# Altium schematic sheet 03 DRV.SchDoc
size A4; SheetNumber: 3; SheetTotal: 4
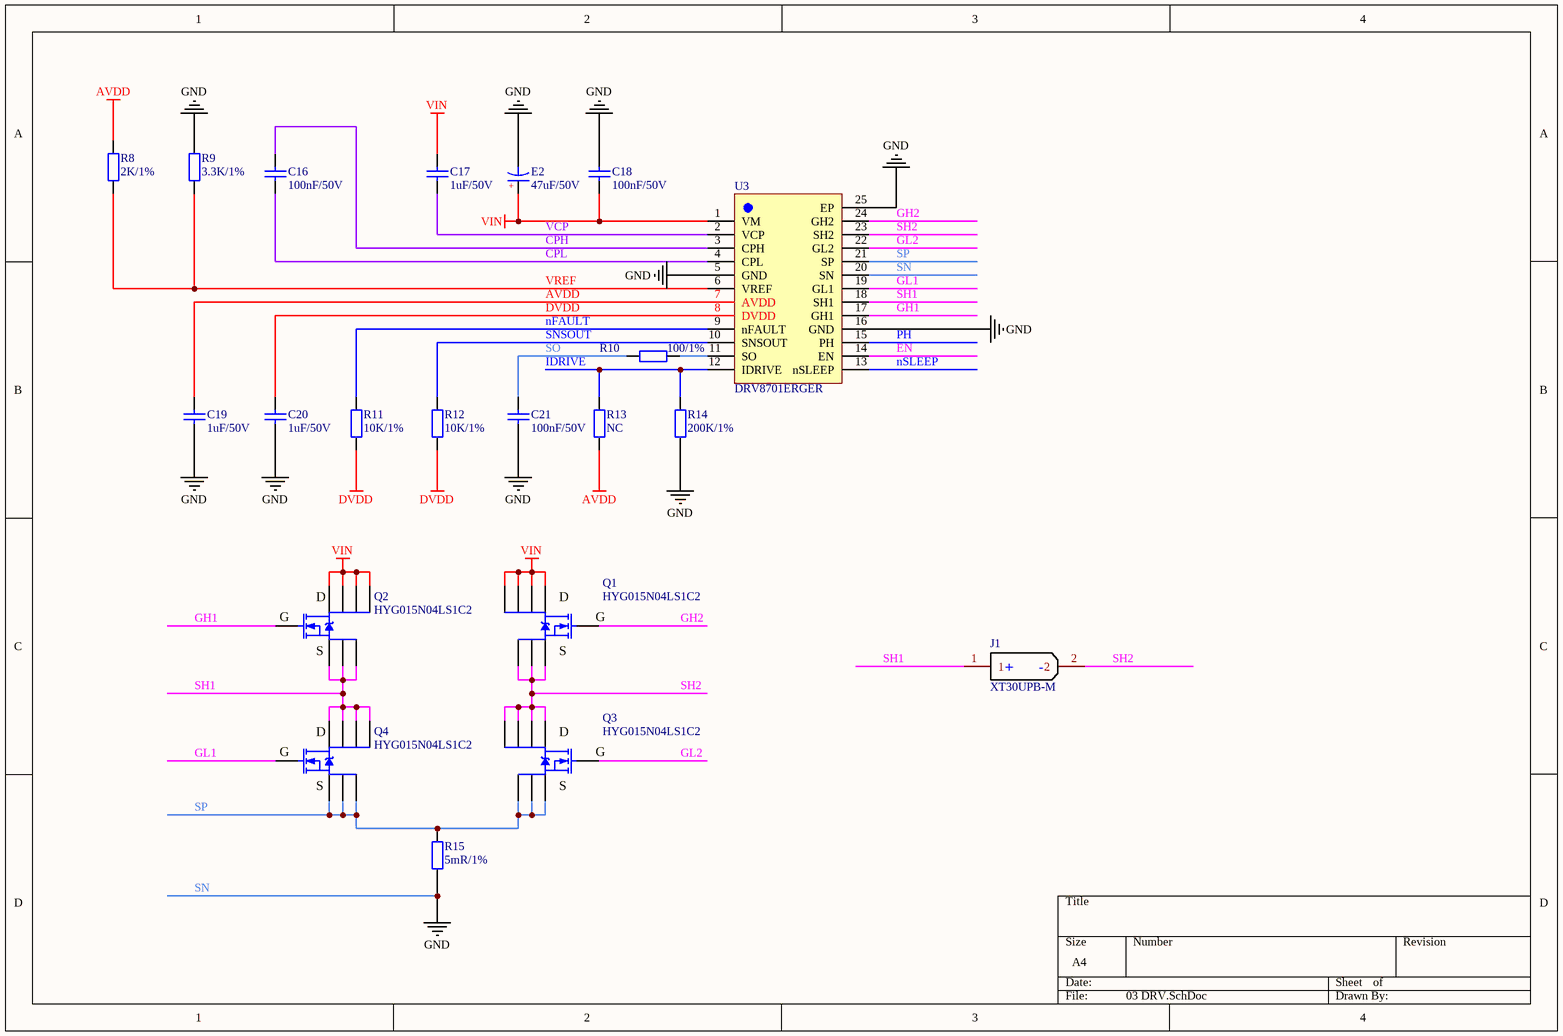
[diagram p0: 03 DRV.SchDoc]

## Parts
C16  100nF/50V  [C0603_L]
C17  1uF/50V  [C0603_L]
C18  100nF/50V  [C0603_L]
C19  1uF/50V  [C0603_L]
C20  1uF/50V  [C0603_L]
C21  100nF/50V  [C0603_L]
E2  47uF/50V  [CE D(6.3*5.4)]
J1  XT30UPB-M  [XT30-M]
Q1  HYG015N04LS1C2  [PowerFLAT-8(5x6)]
Q2  HYG015N04LS1C2  [PowerFLAT-8(5x6)]
Q3  HYG015N04LS1C2  [PowerFLAT-8(5x6)]
Q4  HYG015N04LS1C2  [PowerFLAT-8(5x6)]
R8  2K/1%  [R0603_L]
R9  3.3K/1%  [R0603_L]
R10  100/1%  [R0603_L]
R11  10K/1%  [R0603_L]
R12  10K/1%  [R0603_L]
R13  NC  [R0603_L]
R14  200K/1%  [R0603_L]
R15  5mR/1%  [R2512_L]
U3  DRV8701ERGER  [VQFN-24]

## Nets
AVDD: C19.1 R8.2 R13.2 U3.7(AVDD)
DVDD: C20.1 R11.1 R12.1 U3.8(DVDD)
SN: C18.1 C19.2 C20.2 C21.1 E2.2 R9.2 R14.2 R15.1 U3.5(GND) U3.16(GND) U3.20(SN) U3.25(EP)  [also labelled GND]
VIN: C17.2 C18.2 E2.1 Q1.5(D) Q1.6(D) Q1.7(D) Q1.8(D) Q2.5(D) Q2.6(D) Q2.7(D) Q2.8(D) U3.1(VM)
CPH: C16.2 U3.3(CPH)
CPL: C16.1 U3.4(CPL)
EN: U3.14(EN)
GH1: Q2.4(G) U3.17(GH1)
GH2: Q1.4(G) U3.24(GH2)
GL1: Q4.4(G) U3.19(GL1)
GL2: Q3.4(G) U3.22(GL2)
IDRIVE: R13.1 R14.1 U3.12(IDRIVE)
nFAULT: R11.2 U3.9(nFAULT)
nSLEEP: U3.13(nSLEEP)
PH: U3.15(PH)
SH1: J1.1 Q2.1(S) Q2.2(S) Q2.3(S) Q4.5(D) Q4.6(D) Q4.7(D) Q4.8(D) U3.18(SH1)
SH2: J1.2 Q1.1(S) Q1.2(S) Q1.3(S) Q3.5(D) Q3.6(D) Q3.7(D) Q3.8(D) U3.23(SH2)
SNSOUT: R12.2 U3.10(SNSOUT)
SO: C21.2 R10.2
SP: Q3.1(S) Q3.2(S) Q3.3(S) Q4.1(S) Q4.2(S) Q4.3(S) R15.2 U3.21(SP)
VCP: C17.1 U3.2(VCP)
VREF: R8.1 R9.1 U3.6(VREF)
NetR10_1: R10.1 U3.11(SO)

## Notes on the sheet
- (in symbol CE_SMD) +
- (in symbol XT-60) +; -

## Library data of the parts
C16 C18 C21 = C: CC0603KRX7R9BB104; BOM名称: 无极性贴片电容; 联系卖家，免费查找封装: 唯一出售店铺网址https://shop463601444.taobao.com
C17 C19 C20 = C: CL10A105KB8NNNC; BOM名称: 无极性贴片电容; 联系卖家，免费查找封装: 唯一出售店铺网址https://shop463601444.taobao.com
E2 = CE_SMD: RV50V47M6X5; BOM名称: 贴片电解电容; 联系卖家，免费查找封装: 唯一出售店铺网址https://shop463601444.taobao.com
J1 = XT-60
Q1-Q4 = STL90N10F7
R8 = R: 0603WAF2001T5E; BOM名称: 贴片电阻; 联系卖家，免费查找封装: 唯一出售店铺网址https://shop463601444.taobao.com
R9 = R: 0603WAF3301T5E; BOM名称: 贴片电阻; 联系卖家，免费查找封装: 唯一出售店铺网址https://shop463601444.taobao.com
R10 = R: 0603WAF1000T5E; BOM名称: 贴片电阻; 联系卖家，免费查找封装: 唯一出售店铺网址https://shop463601444.taobao.com
R11 R12 = R: 0603WAF1002T5E; BOM名称: 贴片电阻; 联系卖家，免费查找封装: 唯一出售店铺网址https://shop463601444.taobao.com
R13 = R: 0603WAF6802T5E; BOM名称: 贴片电阻; 联系卖家，免费查找封装: 唯一出售店铺网址https://shop463601444.taobao.com
R14 = R: 0603WAF2003T5E; BOM名称: 贴片电阻; 联系卖家，免费查找封装: 唯一出售店铺网址https://shop463601444.taobao.com
R15 = R: HoJLR2512-3W-5mR-1%; BOM名称: 贴片电阻; 联系卖家，免费查找封装: 唯一出售店铺网址https://shop463601444.taobao.com
U3 = DRV8701ERGER: DRV8701 DRV8701 H 桥栅极驱动器